# Altium schematic sheet rev-b1_pod_3_Optical.SchDoc
size 297 x 209 mm; Symbol: Drawing-Symbol_A4; @Project Name: Atrium_RevB1; @Page Count: 3; @Update Date: 2026-11-05; @Create Date: 2026-11-05; @Schematic Name: Pod_Schematic; @Page No: 3; @Page Name: P2; Company: Local Forge; Version: V1.0; Page Size: A4; Drawn: Het Bhavsar; Device: Drawing-Symbol_A4; @Create Time: 20:16:02; @Update Time: 20:16:02; Border: 1; Width: 1170; Height: 825; Region Start: 1; X Region Count: 6; Y Region Count: 4; Blade Width: 10; Title Block Position: 3; @Board Name: Pod
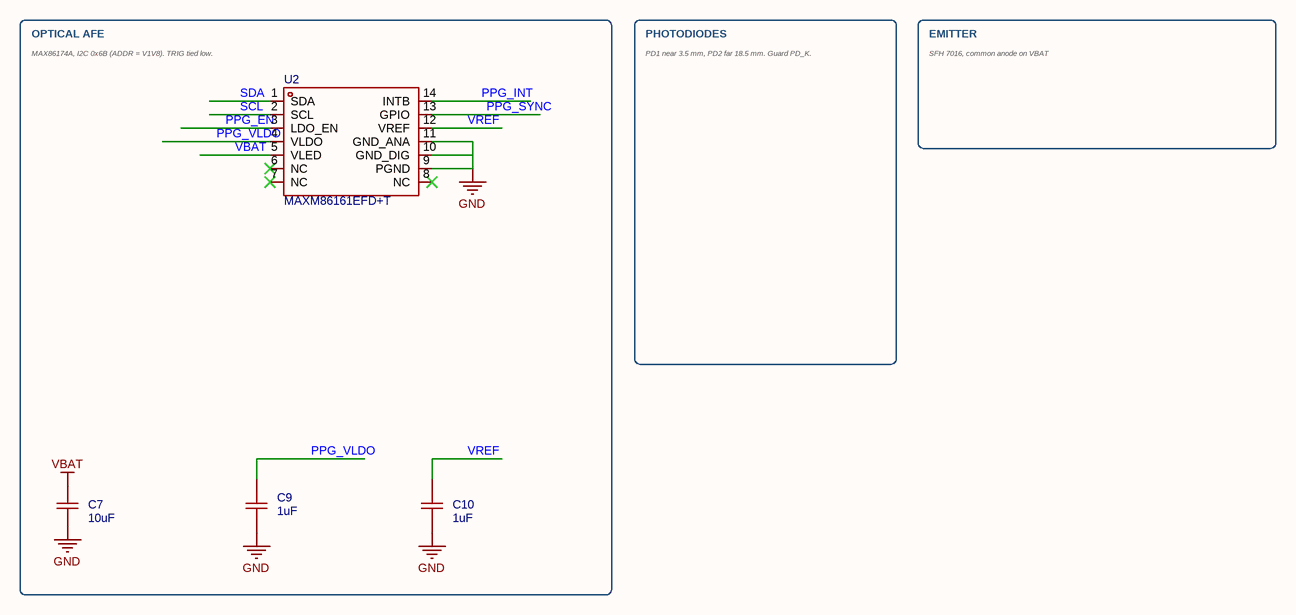
[diagram p0: rev-b1_pod_3_Optical.SchDoc]

## Parts
C7  10uF  [C0402]
C9  1uF  [C0201]
C10  1uF  [C0201]
U2  MAXM86161EFD+T  [OLGA-14_L4.3-W2.9-P0.60-TL]

## Nets
GND: C7.2 C9.2 C10.2 U2.9(PGND) U2.10(GND_DIG) U2.11(GND_ANA)
VBAT: C7.1 U2.5(VLED)
PPG_EN: U2.3(LDO_EN)
PPG_INT: U2.14(INTB)
PPG_SYNC: U2.13(GPIO)
PPG_VLDO: C9.1 U2.4(VLDO)
SCL: U2.2(SCL)
SDA: U2.1(SDA)
VREF: C10.1 U2.12(VREF)

Not connected (* = marked no-connect by the designer): U2 6(NC)* 7(NC)* 8(NC)*

## Notes on the sheet
- OPTICAL AFE
- PHOTODIODES
- EMITTER
- MAX86174A, I2C 0x6B (ADDR = V1V8). TRIG tied low.
- PD1 near 3.5 mm, PD2 far 18.5 mm. Guard PD_K.
- SFH 7016, common anode on VBAT
- Create at
- 2026-11-05
- Schematic
- Board
- Pod_Schematic
- Pod
- Update at
- Page
- P2
- Drawn
- Reviewed
- Het Bhavsar
- Atrium_RevB1
- Version
- V1.0
- Size
- A4
- Page  3  Total  3
- Local Forge

## Library data of the parts
C7 = CL05A106MQ5NUNC: Capacitance:10uF Tolerance:±20% Tolerance:±20% Voltage Rating:6.3V Temperature Coefficient:X5R; Manufacturer: SAMSUNG(三星); Add into BOM: yes; Tolerance: ±20%; Voltage Rating: 6.3V; Temperature Coefficient: X5R; ModelId: b7d13df3e9464d7a99d0651d1a5b4d570819f05c4eef4c71ace90d822a990e87; ModelName: C0402_L1.0-W0.5-H0.5; ModelTransform: 39.37,19.685,0,0,0,0,0,0,0; Symbol: CL05A106MQ5NUNC; Device: CL05A106MQ5NUNC; Convert to PCB: yes; Manufacturer Part: CL05A106MQ5NUNC; Supplier: LCSC; Supplier Part: C15525; LCSC Part Name: 10uF ±20% 6.3V; Supplier Footprint: 0402; JLCPCB Part Class: Basic Part; Datasheet: https://item.szlcsc.com/datasheet/CL05A106MQ5NUNC/16204.html; Value: 10uF; FootprintName: C0402
C9 C10 = GRM033R61A105ME15D: Capacitance:1uF Tolerance:±20% Tolerance:±20% Voltage Rating:10V Temperature Coefficient:X5R; Manufacturer: muRata(村田); Add into BOM: yes; Tolerance: ±20%; Voltage Rating: 10V; Temperature Coefficient: X5R; ModelId: c3e75c3d90204c70b153866ab54c789f0819f05c4eef4c71ace90d822a990e87; ModelName: C0201_L0.6-W0.3-H0.3; ModelTransform: 23.622,11.811,0,0,0,0,0,0,0; Symbol: GRM033R61A105ME15D; Device: GRM033R61A105ME15D; Convert to PCB: yes; Manufacturer Part: GRM033R61A105ME15D; Supplier: LCSC; Supplier Part: C181054; LCSC Part Name: 1uF ±20% 10V; Supplier Footprint: 0201; JLCPCB Part Class: Extended Part; Datasheet: https://item.szlcsc.com/datasheet/GRM033R61A105ME15D/192451.html; Value: 1uF; FootprintName: C0201
U2 = MAXM86161EFD+T: Sensor Type:Optical Sensor Interface:I2C Voltage - Supply:3V~5.5V Voltage - Supply:3V~5.5V Current - Supply:1.6uA Operating Temperature:-40℃~+85℃ Operating Temperature:-40℃~+85℃ Diameter (φD):- Length:4.3mm Width:2.9mm Height:1.4mm Pitch:- Features:FIFO d; Manufacturer: ADI(亚德诺)/MAXIM(美信); Add into BOM: yes; Interface: I2C; Current - Supply: 1.6uA; Symbol: MAXM86161EFD+T; Device: MAXM86161EFD+T; Convert to PCB: yes; Manufacturer Part: MAXM86161EFD+T; Supplier: LCSC; Supplier Part: C3178309; LCSC Part Name: 单电源集成光学模块用于心率和血氧饱和度测量; Supplier Footprint: OLGA-14(2.9x4.3); JLCPCB Part Class: Extended Part; Datasheet: https://item.szlcsc.com/datasheet/MAXM86161EFD%252BT/3740247.html; Sensor Type: Optical Sensor; Voltage - Supply: 3V~5.5V; Operating Temperature: -40℃~+85℃; Diameter (φD): -; Length: 4.3mm; Width: 2.9mm; Height: 1.4mm; Pitch: -; Features: FIFO data buffer；Integrated ADC；Low-power mode；Digital filtering/signal processing; FootprintName: OLGA-14_L4.3-W2.9-P0.60-TL